# Altium schematic sheet Reference_Pot.SchDoc
size A4
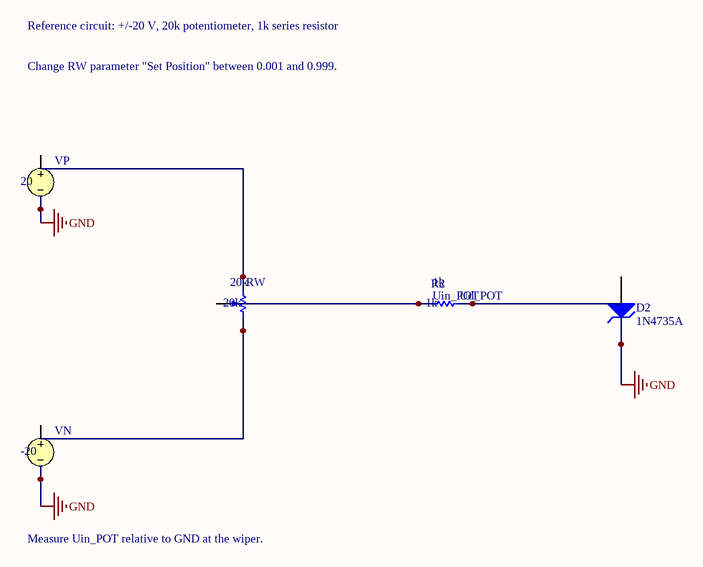
[diagram p0: Reference_Pot.SchDoc]

## Parts
D2  1N4735A  [59-03]
R2  1k  [AXIAL-0.3]
RW  20k  [VR5]
VN  -20
VP  20

## Nets
GND: D2.2(K) VN.2 VP.2
Ud_POT: R2.2
Uin_POT: R2.1

Not connected (* = marked no-connect by the designer): D2 1(A); RW 1(TOP) 2(BOT) 3(TAP); VN 1; VP 1

## Notes on the sheet
- Reference circuit: +/-20 V, 20k potentiometer, 1k series resistor
- Change RW parameter "Set Position" between 0.001 and 0.999.
- Measure Uin_POT relative to GND at the wiper.

## Library data of the parts
D2 = 1N4735A: One Watt Hermetically Sealed Glass Silicon Zener Diode; Published: 29-Sep-2000; LatestRevisionDate: 17-Jul-2002; LatestRevisionNote: Re-released for DXP Platform.; PackageReference: 59-03; Publisher: Altium Limited; PackageDescription: Diode, Axial; Body 5.2 x 2.7 mm (LxDia. max), Lead Dia. 0.86 mm (max); Code_JEDEC: DO-204-AL; ComponentLink1Description: Manufacturer Link; ComponentLink1URL: http://www.onsemi.com/site/products/landing?taxonomyID=194; Value: 1N4735A
R2 = Res1: Resistor; Published: 8-Jun-2000; LatestRevisionDate: 17-Jul-2002; LatestRevisionNote: Re-released for DXP Platform.; PackageReference: AXIAL-0.3; Publisher: Altium Limited; Value: 1k
RW = RPot: Potentiometer; Sim Note: Enter the Resistance value and the set point into parameter fields.; Set Position: 0.5; Published: 8-Jun-2000; LatestRevisionDate: 17-Jul-2002; LatestRevisionNote: Re-released for DXP Platform.; PackageReference: VR5; Publisher: Altium Limited; Value: 20k
VN VP = VSRC: Voltage Source; Note: PCB Footprint - Not required; Published: 8-Jun-2000; LatestRevisionDate: 17-Jul-2002; LatestRevisionNote: Re-released for DXP Platform.; PackageReference: Not Applicable; Publisher: Altium Limited
  VN: Value: -20
  VP: Value: 20